# Altium schematic sheet LCD.SchDoc
size A4
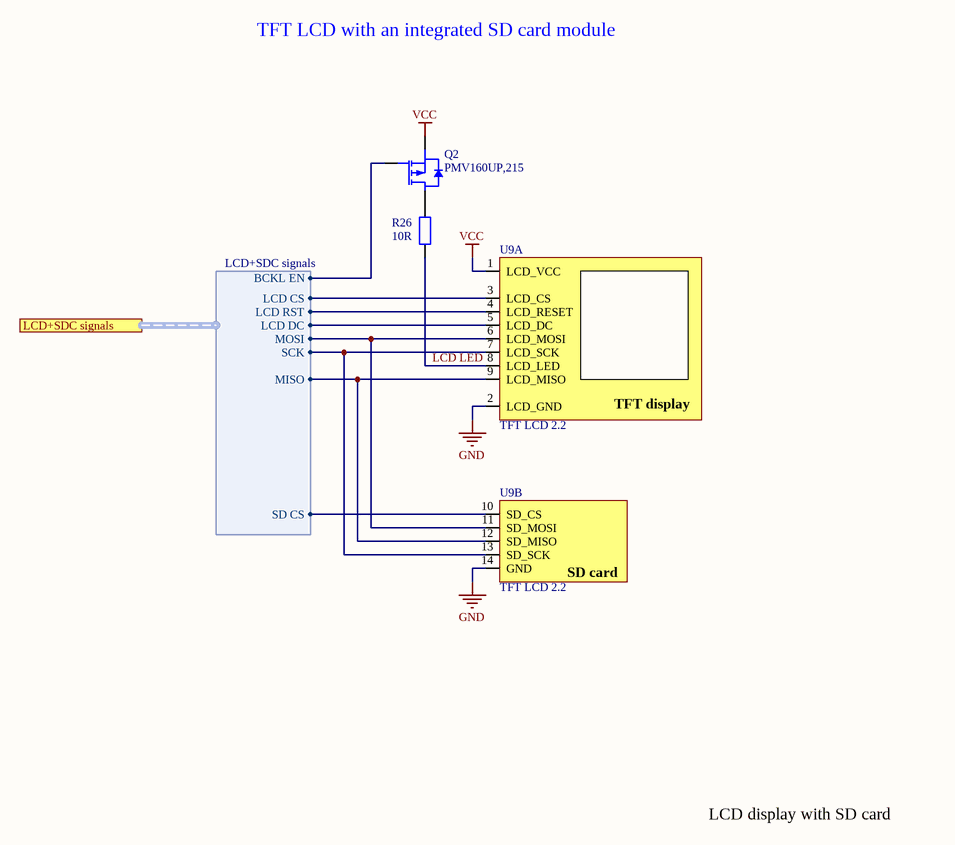
[diagram p0: LCD.SchDoc]

## Parts
Q2  PMV160UP,215  [SOT23-3]
R26  10R  [R_0805]
U9  TFT LCD 2.2  [LCD tft 2.2]  (parts A,B of 2)

## Ports
LCD+SDC signals (harness LCD+SDC signals)

## Harnesses
LCD+SDC signals: BCKL EN, LCD CS, LCD DC, LCD RST, MISO, MOSI, SCK, SD CS

## Nets
GND: U9.2(LCD_GND) U9.14(GND)
VCC: Q2.2(S) U9.1(LCD_VCC)
LCD LED: R26.1 U9.8(LCD_LED)
NetQ2_1: Q2.1(G) ; port LCD+SDC signals.BCKL EN
NetQ2_3: Q2.3(D) R26.2
NetU9_3: U9.3(LCD_CS) ; port LCD+SDC signals.LCD CS
NetU9_4: U9.4(LCD_RESET) ; port LCD+SDC signals.LCD RST
NetU9_5: U9.5(LCD_DC) ; port LCD+SDC signals.LCD DC
NetU9_6: U9.6(LCD_MOSI) U9.11(SD_MOSI) ; port LCD+SDC signals.MOSI
NetU9_7: U9.7(LCD_SCK) U9.13(SD_SCK) ; port LCD+SDC signals.SCK
NetU9_9: U9.9(LCD_MISO) U9.12(SD_MISO) ; port LCD+SDC signals.MISO
NetU9_10: U9.10(SD_CS) ; port LCD+SDC signals.SD CS

## Notes on the sheet
- TFT LCD with an integrated SD card module
- LCD display with SD card
- (in symbol TFT LCD 2.2, part A) TFT display
- (in symbol TFT LCD 2.2, part B) SD card

## Library data of the parts
Q2 = PMV160UP,215: P-Channel Trench MOSFET, -20 V, -1.2 A, -55 to 150 degC, 3-Pin SOT23, Tape and Reel; Manufacturer: NXP Semiconductors; Channel Type: P; Ciss [typ] (pF): 365; Coss [typ] (pF): 42; Packing: Tape & Reel; VGSth [typ] (V): -0.7; DatasheetVersion: Rev. 2; PackageVersion: 06-03-16, 03/2006; PackageReference: SOT23; PackageDescription: 3-Pin Small Outline Transistor Package, Body 2.9 x 1.3 mm, Pitch 0.95 mm; Supplier 1: Digi-Key; Supplier Part Number 1: 568-10320-2-ND; Supplier 2: Digi-Key; Supplier Part Number 2: 568-10320-1-ND; Supplier 3: Digi-Key; Supplier Part Number 3: 568-10320-6-ND; Supplier 4: Newark; Supplier Part Number 4: 54T9404; Supplier 5: Mouser; Supplier Part Number 5: 771-PMV160UP215; ID [max] (A): -1.2; VDS [max] (V): -20; Mounting Technology: Surface Mount; Code_JEDEC: TO-236AB; PartNumber: PMV160UP,215; ComponentLink1Description: Manufacturer URL; ComponentLink1URL: http://www.nxp.com/; ComponentLink2Description: Datasheet; ComponentLink2URL: http://www.nxp.com/documents/data_sheet/PMV160UP.pdf; ComponentLink3Description: Package Specification; ComponentLink3URL: http://www.nxp.com/documents/outline_drawing/sot023_po.pdf; HelpURL: https://eu.mouser.com/datasheet/2/916/PMV160UP-1600107.pdf
R26 = Resistor: Generic resistor; Value: 10R
U9 = TFT LCD 2.2: LCD 320x240, 65536 color, ILI3941